# Altium schematic sheet Sheet1.SchDoc
size A; SheetNumber: 1; SheetTotal: 1
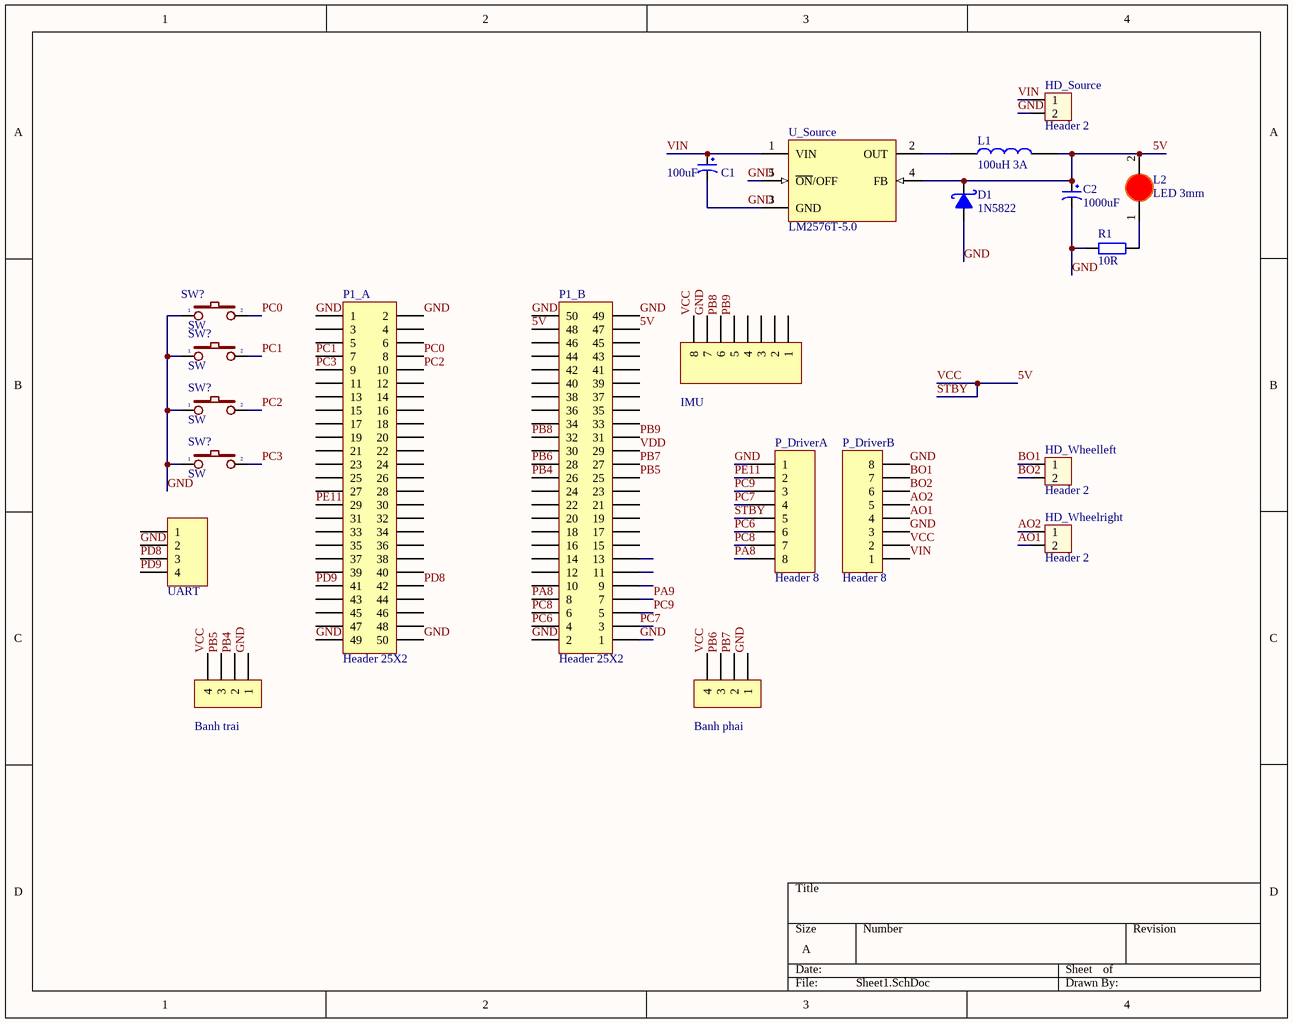
[diagram p0: Sheet1.SchDoc]

## Parts
(Parts that share a designator on the sheet are numbered #1, #2 ... from top to bottom, then left to right.)
C1  100uF  [tu hoa 5mm]
C2  1000uF  [tu hoa 13mm]
D1  1N5822  [D5A]
H_BanhPhai  Banh phai  [XH2.54M-4]
H_BanhTrai  Banh trai  [XH2.54M-4]
HD_Source  Header 2  [HED2]
HD_Wheelleft  Header 2  [HED2]
HD_Wheelright  Header 2  [HED2]
L1  100uH 3A  [CUON CAM 100uH3A]
L2  LED 3mm  [LED-3MM-RED]
P1_A  Header 25X2  [HDR2X25]
P1_B  Header 25X2  [HDR2X25]
P_DriverA  Header 8  [HDR1X8]
P_DriverB  Header 8  [HDR1X8]
P_IMU  IMU  [HDR1X8H]
P_UART  UART  [HDR1X4H]
R1  10R  [tro smd 0805]
SW?#1  SW  [SW2]
SW?#2  SW  [SW2]
SW?#3  SW  [SW2]
SW?#4  SW  [SW2]
U_Source  LM2576T-5.0  [LM2576t]

## Nets
5V: C2.1 D1.2(K) H_BanhPhai.4 H_BanhTrai.4 L1.2 L2.2(K) P1_B.47 P1_B.48 P_DriverA.5 P_DriverB.2 P_IMU.8 U_Source.4(FB)  [also labelled STBY, VCC]
AO1: HD_Wheelright.2 P_DriverB.4
AO2: HD_Wheelright.1 P_DriverB.5
BO1: HD_Wheelleft.1 P_DriverB.7
BO2: HD_Wheelleft.2 P_DriverB.6
GND: C1.2 C2.2 D1.1(A) H_BanhPhai.1 H_BanhTrai.1 HD_Source.2 P1_A.1 P1_A.2 P1_A.49 P1_A.50 P1_B.1 P1_B.2 P1_B.49 P1_B.50 P_DriverA.1 P_DriverB.3 P_DriverB.8 P_IMU.7 P_UART.2 R1.2 SW?#1.1 SW?#2.1 SW?#3.1 SW?#4.1 U_Source.3(GND) U_Source.5(~{ON}/OFF)
PA8: P1_B.8 P_DriverA.8
PA9: P1_B.7
PB4: H_BanhTrai.2 P1_B.26
PB5: H_BanhTrai.3 P1_B.25
PB6: H_BanhPhai.3 P1_B.28
PB7: H_BanhPhai.2 P1_B.27
PB8: P1_B.32 P_IMU.6
PB9: P1_B.31 P_IMU.5
PC0: P1_A.8 SW?#1.2
PC1: P1_A.7 SW?#2.2
PC2: P1_A.10 SW?#3.2
PC3: P1_A.9 SW?#4.2
PC6: P1_B.4 P_DriverA.6
PC7: P1_B.3 P_DriverA.4
PC8: P1_B.6 P_DriverA.7
PC9: P1_B.5 P_DriverA.3
PD8: P1_A.42 P_UART.3
PD9: P1_A.41 P_UART.4
PE11: P1_A.29 P_DriverA.2
VDD: P1_B.29
VIN: C1.1 HD_Source.1 P_DriverB.1 U_Source.1(VIN)
NetL1_1: L1.1 U_Source.2(OUT)
NetL2_1: L2.1(A) R1.1

Not connected (* = marked no-connect by the designer): P1_A 3 4 5 6 11 12 13 14 15 16 17 18 19 20 21 22 23 24 25 26 27 28 30 31 32 33 34 35 36 37 38 39 40 43 44 45 46 47 48; P1_B 9 10 11 12 13 14 15 16 17 18 19 20 21 22 23 24 30 33 34 35 36 37 38 39 40 41 42 43 44 45 46; P_IMU 1 2 3 4; P_UART 1

## Library data of the parts
C1 = Tu Hoa 100uF 25V 6x11: Cắm; Don_Vi: Con; So_Chan: 2; Ten_Linh_Kien: Tụ Hóa 100uF 25V 6x11MM; Ma_Hang: MH001351; Chung_Loai: Cắm; Kieu_Chan: *
C2 = Tu Hoa 1000uF 25V 13x21: Cắm; Don_Vi: Con; So_Chan: 2; Ten_Linh_Kien: Tụ Hóa 1000uF 25V 13x21MM; Ma_Hang: MH002315; Chung_Loai: Cắm; Kieu_Chan: *
D1 = 1N5822: Schottky Rectifiers; Value: Diode c?m 1N5408
H_BanhPhai H_BanhTrai = Header 4P 2.54 Duc Thang: Cắm; Ten_Linh_Kien: Header 4P XH2.54-4P Đực Thẳng; Don_Vi: Con; Ma_Hang: MH001285; Chung_Loai: Cắm
HD_Source HD_Wheelleft HD_Wheelright = Hed2: Header 2 (Green); Value: Header 2
L1 = CUON CAM 100uH DIP: Dán; Don_Vi: Con; Ma_Hang: MH002209; Ten_Linh_Kien: Cuộn Cảm 100uH 3A 8x10MM; Chung_Loai: Dán; Ghi Chu: *; Kieu Chan: *
L2 = LED 3mm Do: Cắm; Don_Vi: Con; Ma_Hang: MH003892; Ten_Linh_Kien: Led 3MM Phủ Đỏ (10c); Ghi_Chu: *; Kieu_Chan: *; Chung_Loai: Cắm
P1_A P1_B = Header 25X2: Header, 25-Pin, Dual row; LatestRevisionDate: 17-Jul-2002; LatestRevisionNote: Re-released for DXP Platform.; Publisher: Altium Limited
P_DriverA P_DriverB = Header 8: Header, 8-Pin; LatestRevisionDate: 17-Jul-2002; LatestRevisionNote: Re-released for DXP Platform.; Publisher: Altium Limited
P_IMU = Header 8H: Header, 8-Pin, Right Angle; LatestRevisionDate: 17-Jul-2002; LatestRevisionNote: Re-released for DXP Platform.; Publisher: Altium Limited
P_UART = Header 4H: Header, 4-Pin, Right Angle; LatestRevisionDate: 17-Jul-2002; LatestRevisionNote: Re-released for DXP Platform.; Publisher: Altium Limited
R1 = Tro 0805 1% 10R: Dán; Don_Vi: Con; So_Chan: 2; Ten_Linh_Kien: Trở 0805 1% 10R; Ma_Hang: MH005474; Chung_Loai: Dán; Kieu_Chan: *
SW?#1-SW?#4 = SW2: Switch button 2 pin; Value: SW chip 2 pin
U_Source = LM2576T-5.0: SIMPLE SWITCHER; 3A Step-Down Voltage Regulator; Manufacturer: National Semiconductor; PackageTopMarking: NSUZXYTT*LM2576T*-5.0 P+; PowerWise: N; FirstPublished: 4-Dec-2008; DatasheetVersion: Aug-2004; PackageVersion: revJ, Jan-1992; PackageReference: T05A; Publisher: Altium Limited; PackageDescription: TO-220, Molded, 5 Lead, Straight; CompType: Switcher; PartNumber: LM2576T-5.0; RoHS: O; PinCount: 5; DigiKeyPartNumber: LM2576T-5.0-ND; Code_JEDEC: TO-220-AB; ComponentLink1Description: LM2576 Datasheet; ComponentLink1URL: http://www.national.com/ds/LM/LM2576.pdf; ComponentLink2Description: LM2576 Web Page; ComponentLink2URL: http://www.national.com/pf/LM/LM2576.html; ComponentLink3Description: T05A Package Page; ComponentLink3URL: http://www.national.com/packaging/folders/t05a.html